# Altium schematic sheet 昆虫_USB蓝牙版V1.1.SchDoc
size A4
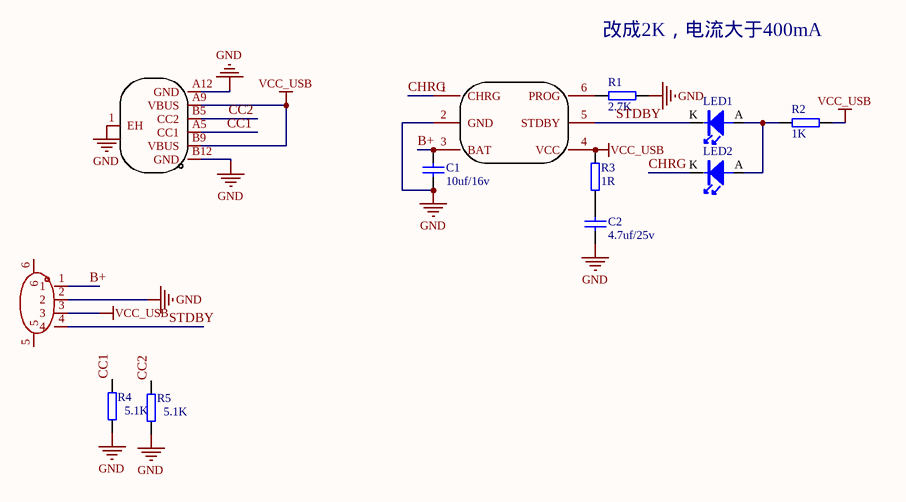
[diagram p0: 昆虫_USB蓝牙版V1.1.SchDoc]

## Parts
C1  10uf/16v  [0603_C]
C2  4.7uf/25v  [0603_C]
CN1  1.25-4p wt  [CONN-SMD_1.25-4PWT]  (value not drawn)
LED1  (no value)  [D0603]
LED2  (no value)  [D0603]
R1  2.7K  [0603_R]
R2  1K  [0603_R]
R3  1R  [0603_R]
R4  5.1K  [0603_R]
R5  5.1K  [0603_R]
U1  TP4083-42 4057  [SOT-23-6]  (value not drawn)
USB1  TYPE-C 6P LTH6.8  [TYPE C 6P 6.8MM]  (value not drawn)

## Nets
GND: C1.2 C2.2 CN1.2 R1.1 R4.2 R5.2 U1.2(GND) USB1.1(EH) USB1.A12(GND) USB1.B12(GND)
VCC_USB: CN1.3 R2.1 R3.2 U1.4(VCC) USB1.A9(VBUS) USB1.B9(VBUS)
B+: C1.1 CN1.1 U1.3(BAT)
CC1: R4.1 USB1.A5(CC1)
CC2: R5.1 USB1.B5(CC2)
CHRG: LED2.K U1.1(CHRG)
STDBY: CN1.4 LED1.K U1.5(STDBY)
NetC2_1: C2.1 R3.1
NetLED1_A: LED1.A LED2.A R2.2
NetR1_2: R1.2 U1.6(PROG)

Not connected (* = marked no-connect by the designer): CN1 5 6

## Notes on the sheet
- 改成2K，电流大于400mA

## Library data of the parts
C1 C2 = Cap: Capacitor; Value: 10nF; Published: 8-Jun-2000; Revision: July-2002: Re-released for DXP Platform.; Publisher: Altium Limited
CN1 = 1.25-4p wt: AddInBom: yes; ModelId: 9a16aea22ff94a0784ec3f8d019ec98c; ModelName: CONN-SMD_MX1.25-WS-4P; ModelTransform: 399.6055,204.3303,0,180,0,0,0,35.435,0; Pins Structure: 1x4P; Pitch: 1.25mm; Reference Series: PicoBlade(MX 1.25); Number of PINs Per Row: 4; Current Rating: 1A; Voltage Rating: 125V; Plastic Material: LCP; Flame Retardant Rating: UL94V-0; Symbol: 1.25-4P WT; SupplierPart: C668615; ManufacturerPart: 1.25-4P WT; JLCPCB Part Class: Extended Part; Datasheet: https://item.szlcsc.com/datasheet/1.25-4P%2520WT/698558.html; Supplier: LCSC; ConvertToPcb: yes; FootprintName: CONN-SMD_1.25-4PWT; Number of Pins: 4P; Number of Rows: 1; Row Spacing: -
LED1 LED2 = LED: 发光二极管
R1-R5 = RES
U1 = TP4057-42-SOT26-R: Symbol: TP4057; Add into BOM: yes; Device: TP4057-42-SOT26-R; LCSC Part Name: TP4057 1%; Supplier Part: C12044; Manufacturer Part: TP4057-42-SOT26-R; Supplier Footprint: SOT-23-6; JLCPCB Part Class: Extended Part; Datasheet: https://atta.szlcsc.com/upload/public/pdf/source/20140228/1457706997013.pdf; Supplier: LCSC; Convert to PCB: yes
USB1 = TYPE-C 6P LTH6.5: Add into BOM: yes; Number of Ports: 1; Current Rating - Power (Max): 3A; Symbol: TYPE-C 6P LTH6.5; Device: TYPE-C 6P LTH6.5; Supplier: LCSC; Supplier Part: C5187463; Manufacturer Part: TYPE-C 6P LTH6.5; JLCPCB Part Class: Extended Part; Supplier Footprint: SMD; Datasheet: https://atta.szlcsc.com/upload/public/pdf/source/20220929/CF5EB2C50F637B805AA82EC2C8F335C3.pdf; Convert to PCB: yes; Connector Type: Type-C; Number of Contacts: 6P